# Altium schematic sheet Power_Section.SchDoc
size A; DocumentNumber: 4; SheetNumber: 5; SheetTotal: 6
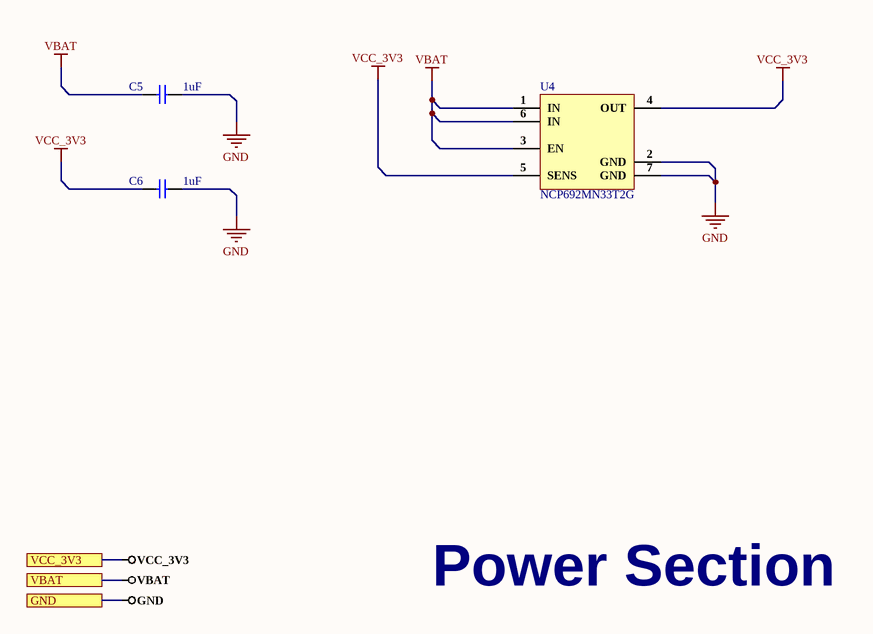
[diagram p0: Power_Section.SchDoc]

## Parts
C5  1uF  [CAP-0603]
C6  1uF  [CAP-0603]
U4  NCP692MN33T2G  [6-DFN (3x3)]

## Ports
GND, VBAT, VCC_3V3

## Nets
GND: C5.2 C6.2 U4.2(GND) U4.7(GND) ; port GND
VBAT: C5.1 U4.1(IN) U4.3(EN) U4.6(IN) ; port VBAT
VCC_3V3: C6.1 U4.4(OUT) U4.5(SENS) ; port VCC_3V3

## Notes on the sheet
- Power Section

## Library data of the parts
C5 C6 = CL10A105KA8NNNC: Ceramic capacitor SMD-0603 1000nF/25V X7R# K +-10%, Samsung, RoHS; Tolerance: 10%; Dielectric: X5R; Voltage: 25V; Supplier 1: Digi-Key; Manufacturer: Samsung; Manufacturer Part Number: CL10A105KA8NNNC; RoHS: Yes; Category: Ceramic Capacitors; Pricing 1: 1=0.10000, 10=0.03500, 50=0.01940, 100=0.01580, 500=0.01128, 1000=0.00886 (USD); Mount: Surface Mount; Case/Package: 0603; Case Code (Metric): 1608; Case Code (Imperial): 0603; Material: Ceramic; Contact Plating: Tin; Min Operating Temperature: -55°C; Max Operating Temperature: 85°C; Capacitance: 1uF; Voltage Rating (DC): 25V; Packaging: Tape and Reel; Package Quantity: 1; Voltage Rating: 25V; Series: CL; Length: 0.063inch; Width: 0.031inch; Height: 0.8mm; Depth: 0.8mm; Thickness: 0.035inch; Radiation Hardening: No; Lead Free: Lead Free; RoHS Compliant: Yes; ComponentLink1URL: https://datasheet.ciiva.com/25801/cl10a105ka8nnnc-25801364.pdf?src-supplier=Digi-Key; ComponentLink1Description: https://datasheet.ciiva.com/25801/cl10a105ka8nnnc-25801364.pdf?src-supplier=Digi-Key; ComponentLink2URL: https://datasheet.ciiva.com/26838/getdatasheetpartid-357530-26838332.pdf?src-supplier=Verical; ComponentLink2Description: https://datasheet.ciiva.com/26838/getdatasheetpartid-357530-26838332.pdf?src-supplier=Verical; ComponentLink3URL: https://datasheet.ciiva.com/29198/458162-da-01-en-vs-kondensator-0603-29198475.pdf?src-supplier=Conrad; ComponentLink3Description: https://datasheet.ciiva.com/29198/458162-da-01-en-vs-kondensator-0603-29198475.pdf?src-supplier=Conrad; Supplier Part Number 1: 1276-1102-6-ND
U4 = NCP692MN33T2G: ON Semiconductor NCP692MN33T2G, LDO Voltage Regulator, 1A, 3.3 V 2%, 1.5  6 Vin, 6-Pin DFN; Output Voltage: 3.3V; Number of Outputs: 1; Min Input Voltage: 1.5V; Max Input Voltage: 6V; Dropout Voltage: 180mV; Min Current Limit: 1.1A; Polarity: Positive; Output Type: Fixed; Supplier 1: Digi-Key; Manufacturer: ON Semiconductor; Manufacturer Part Number: NCP692MN33T2G; RoHS: Yes; Category: Voltage Regulators - Linear; Pricing 1: 1=1.11000, 10=0.98800, 25=0.93800, 100=0.77040, 250=0.72016, 500=0.63642, 1000=0.55300 (USD); Mount: Surface Mount; Case/Package: DFN; Number of Pins: 6; Min Operating Temperature: -40°C; Max Operating Temperature: 85°C; Package Quantity: 3000; Output Current: 1A; Packaging: Tape and Reel; Number of Regulators: 1; Max Output Current: 1A; Output Voltage Accuracy: 2%; Accuracy: 2%; Length: 3mm; Width: 3mm; Height: 0.95mm; Radiation Hardening: No; Lead Free: Lead Free; Halogen Free: Halogen Free; RoHS Compliant: Yes; ComponentLink1URL: https://datasheet.ciiva.com/15271/ncp690-d-15271367.pdf?src-supplier=Arrow+Europe; ComponentLink1Description: https://datasheet.ciiva.com/15271/ncp690-d-15271367.pdf?src-supplier=Arrow+Europe; ComponentLink2URL: https://datasheet.ciiva.com/8231/ncp690-d-8231800.pdf?src-supplier=Avnet; ComponentLink2Description: https://datasheet.ciiva.com/8231/ncp690-d-8231800.pdf?src-supplier=Avnet; ComponentLink3URL: https://datasheet.ciiva.com/2062/ncp690-d-2062340.pdf?src-supplier=Digi-Key; ComponentLink3Description: https://datasheet.ciiva.com/2062/ncp690-d-2062340.pdf?src-supplier=Digi-Key; ComponentLink4URL: https://datasheet.ciiva.com/26179/ncp690-d-26179095.pdf?src-supplier=Avnet+Europe; ComponentLink4Description: https://datasheet.ciiva.com/26179/ncp690-d-26179095.pdf?src-supplier=Avnet+Europe; Supplier Part Number 1: NCP692MN33T2GOSCT-ND